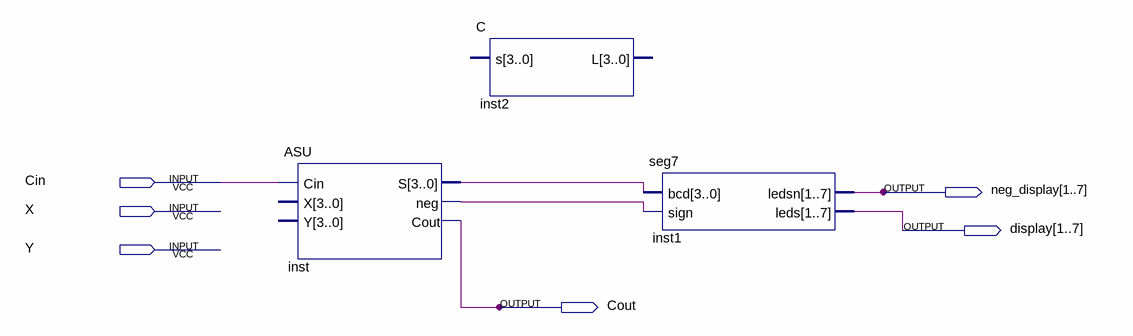
[diagram p0: schematic sheet]
// Quartus schematic Block2.bdf as structural Verilog: 3 symbols, 6 pins
module Block2 (
  input  Cin,
  input  X,
  input  Y,
  output [1:7] neg_display,
  output [1:7] display,
  output Cout
);

  wire inst_neg;
  wire [3:0] inst_s;

  ASU inst (.Cin(Cin), .S(inst_s), .neg(inst_neg), .Cout(Cout));  // open: X, Y
  C inst2 ();  // open: s, L
  seg7 inst1 (.bcd(inst_s), .sign(inst_neg), .ledsn(neg_display), .leds(display));
endmodule
